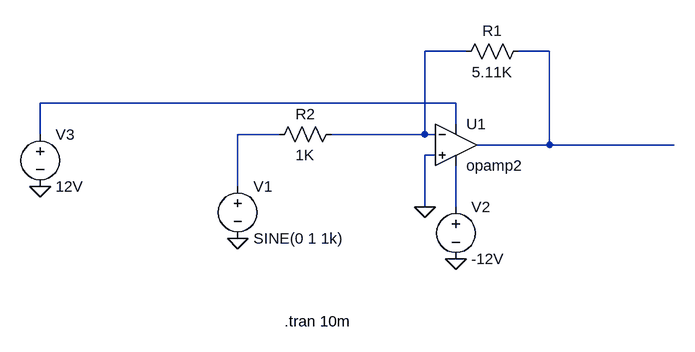
[diagram p0: schematic Draft1.asc]
Draft1.asc, the LTspice schematic file:
Version 4.1
SHEET 1 880 680
WIRE 192 32 128 32
WIRE 320 32 272 32
WIRE 176 112 -464 112
WIRE 176 144 176 112
WIRE -464 160 -464 112
WIRE -96 160 -160 160
WIRE 128 160 128 32
WIRE 128 160 -16 160
WIRE 144 160 128 160
WIRE 320 176 320 32
WIRE 320 176 208 176
WIRE 512 176 320 176
WIRE 144 192 128 192
WIRE -160 240 -160 160
WIRE 128 272 128 192
WIRE 176 272 176 208
FLAG -160 320 0
FLAG 128 272 0
FLAG 176 352 0
FLAG -464 240 0
SYMBOL OpAmps\\opamp2 176 112 R0
SYMATTR InstName U1
SYMBOL res 288 16 R90
WINDOW 0 0 56 VBottom 2
WINDOW 3 32 56 VTop 2
SYMATTR InstName R1
SYMATTR Value 5.11K
SYMATTR SpiceLine tol=1 pwr=0.1
SYMBOL res 0 144 R90
WINDOW 0 0 56 VBottom 2
WINDOW 3 32 56 VTop 2
SYMATTR InstName R2
SYMATTR Value 1K
SYMATTR SpiceLine tol=1 pwr=0.1
SYMBOL voltage -160 224 R0
WINDOW 123 0 0 Left 0
WINDOW 39 0 0 Left 0
SYMATTR InstName V1
SYMATTR Value SINE(0 1 1k)
SYMBOL voltage 176 256 R0
WINDOW 123 0 0 Left 0
WINDOW 39 0 0 Left 0
SYMATTR InstName V2
SYMATTR Value -12V
SYMBOL voltage -464 144 R0
WINDOW 123 0 0 Left 0
WINDOW 39 0 0 Left 0
SYMATTR InstName V3
SYMATTR Value 12V
TEXT -88 448 Left 2 !.tran 10m

The netlist it stands for:
* Draft1.asc
X§U1 0 N001 N003 N005 N002 opamp2  ; pins In+ In- V+ V- OUT
R1 N002 N001 5.11K tol=1 pwr=0.1
R2 N001 N004 1K tol=1 pwr=0.1
V1 N004 0 SINE(0 1 1k)
V2 N005 0 -12V
V3 N003 0 12V
.tran 10m
.backanno
.end